# Altium schematic sheet IMX6ULL_CORE.SchDoc
size A3; SheetNumber: 1; SheetTotal: 3
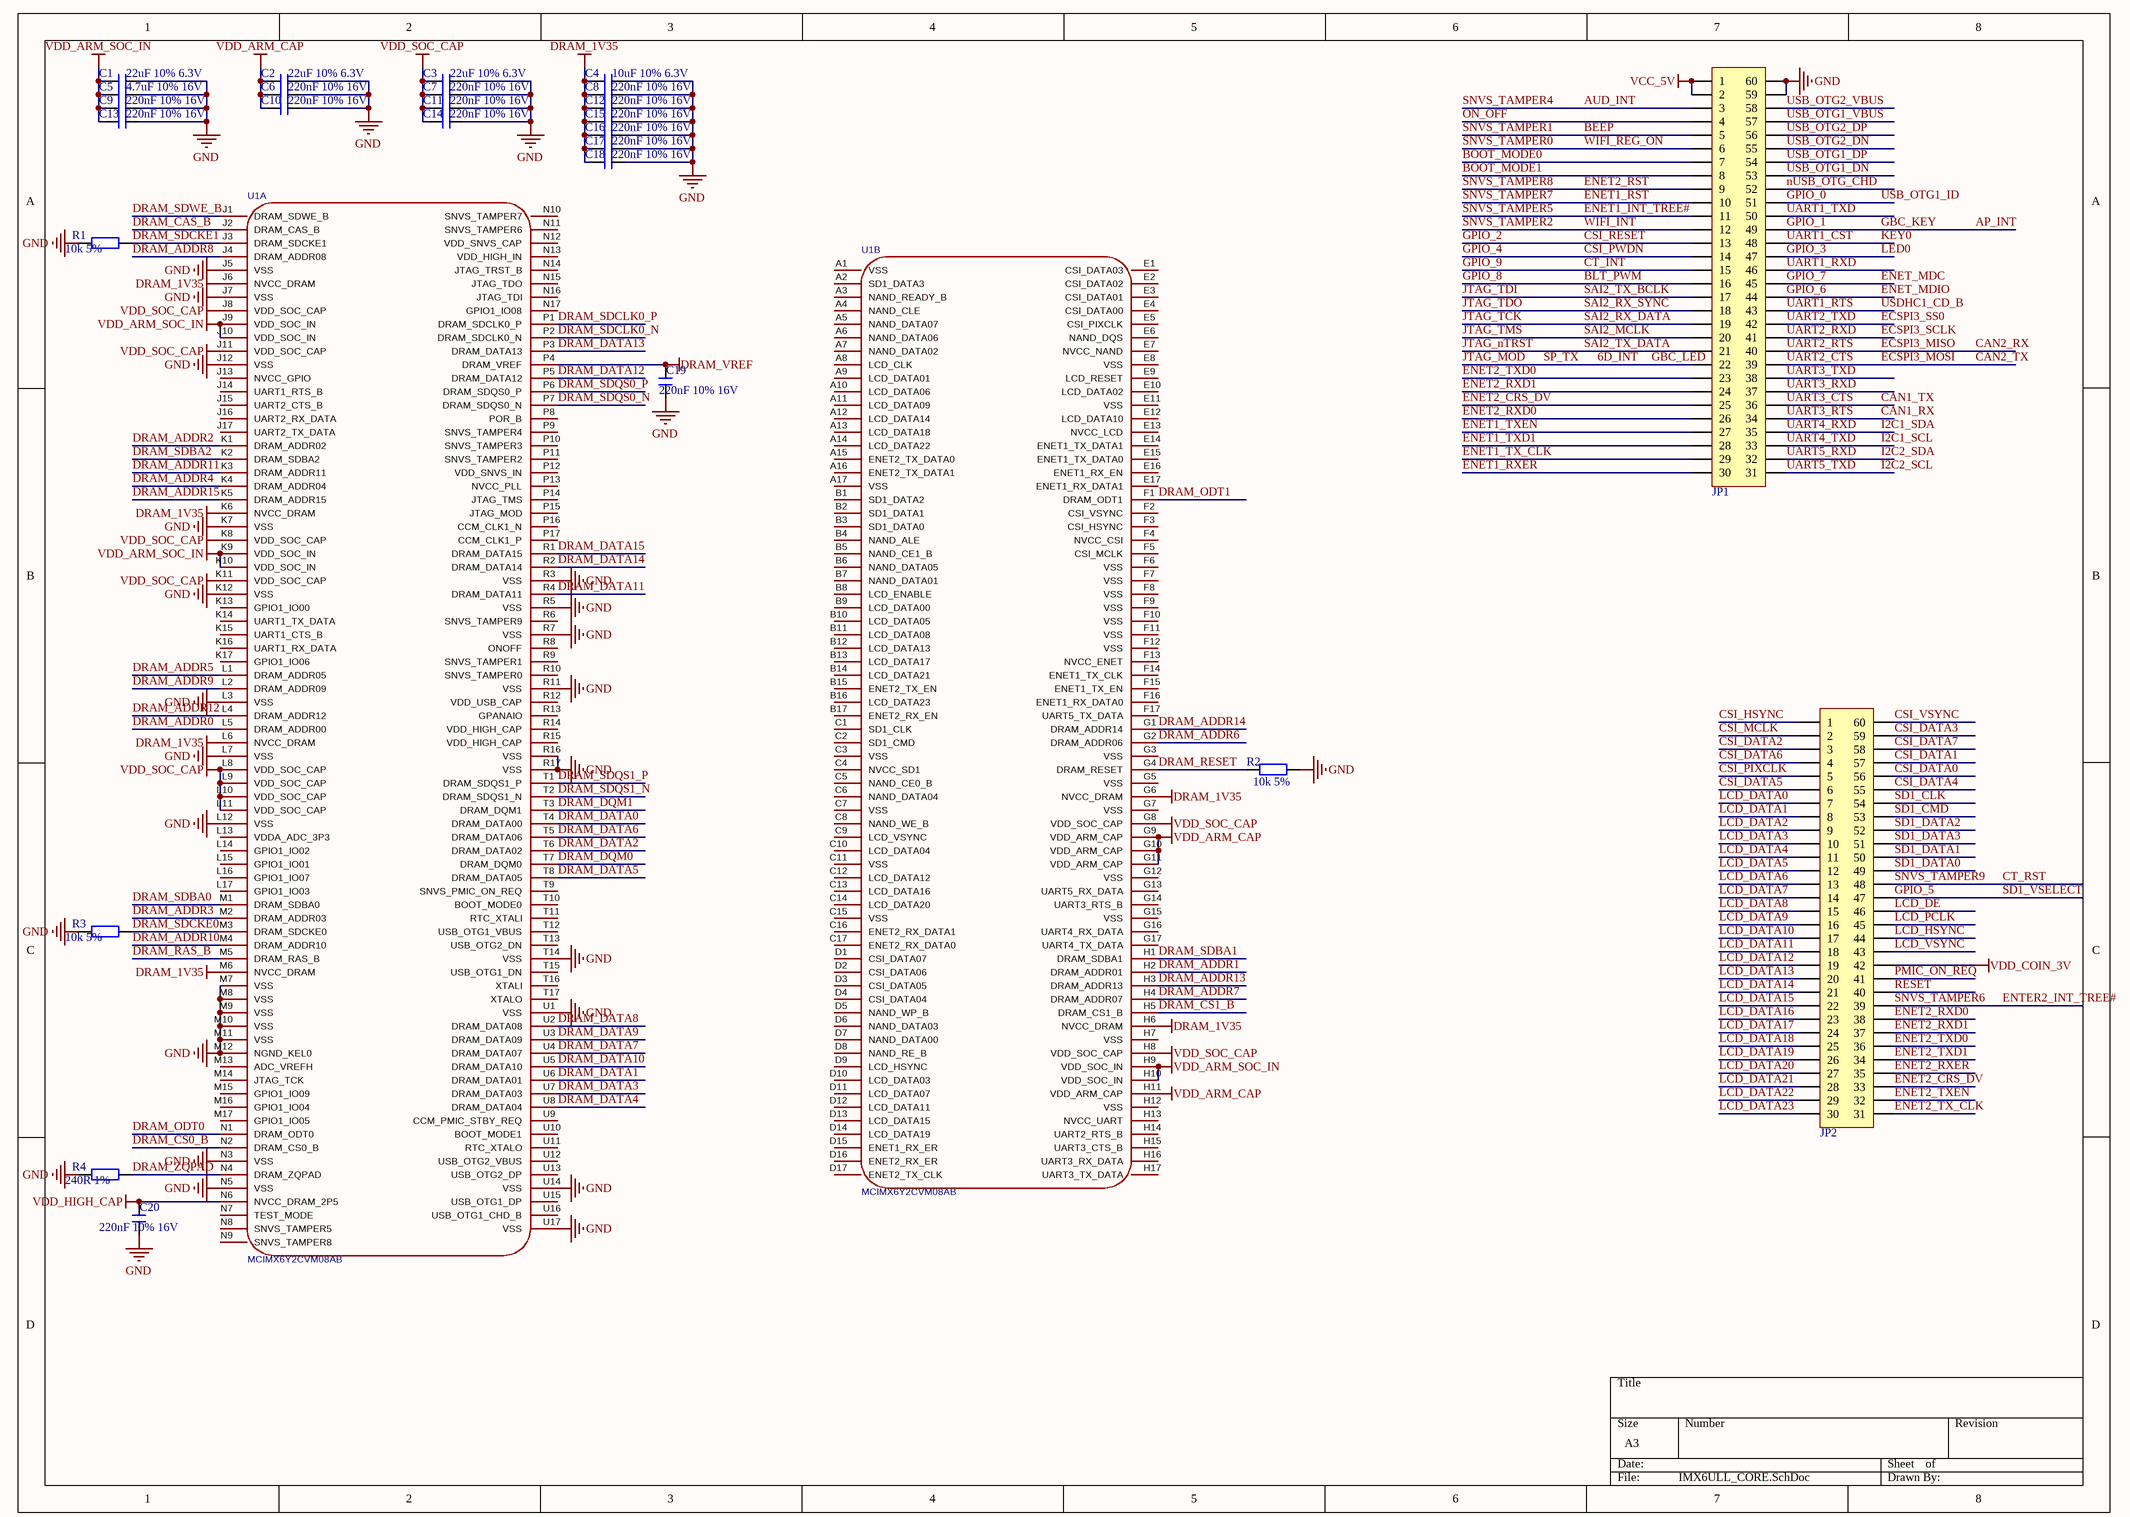
[diagram p0: IMX6ULL_CORE.SchDoc]

## Parts
C1  22uF 10% 6.3V  [C0603_L]
C2  22uF 10% 6.3V  [C0603_L]
C3  22uF 10% 6.3V  [C0603_L]
C4  10uF 10% 6.3V  [C0603_L]
C5  4.7uF 10% 16V  [C0603_L]
C6  220nF 10% 16V  [C0603_L]
C7  220nF 10% 16V  [C0603_L]
C8  220nF 10% 16V  [C0603_L]
C9  220nF 10% 16V  [C0603_L]
C10  220nF 10% 16V  [C0603_L]
C11  220nF 10% 16V  [C0603_L]
C12  220nF 10% 16V  [C0603_L]
C13  220nF 10% 16V  [C0603_L]
C14  220nF 10% 16V  [C0603_L]
C15  220nF 10% 16V  [C0603_L]
C16  220nF 10% 16V  [C0603_L]
C17  220nF 10% 16V  [C0603_L]
C18  220nF 10% 16V  [C0603_L]
C19  220nF 10% 16V  [C0603_L]
C20  220nF 10% 16V  [C0603_L]
JP1  Header 2X30  [IDC2.54-LI-2x30P]  (value not drawn)
JP2  Header 2X30  [IDC2.54-LI-2x30P]  (value not drawn)
R1  10k 5%  [R0603_L]
R2  10k 5%  [R0603_L]
R3  10k 5%  [R0603_L]
R4  240R 1%  [R0603_L]
U1  MCIMX6Y2CVM08AB  [BGA-289_L14.0-W14.0-R17-C17-P0.80-BL]  (parts A,B of 2)

## Nets
DRAM_1V35: C4.1 C8.1 C12.1 C15.1 C16.1 C17.1 C18.1 U1.G6(NVCC_DRAM) U1.H6(NVCC_DRAM) U1.J6(NVCC_DRAM) U1.K6(NVCC_DRAM) U1.L6(NVCC_DRAM) U1.M6(NVCC_DRAM)
DRAM_VREF: C19.2 U1.P4(DRAM_VREF)
GND: C1.2 C2.2 C3.2 C4.2 C5.2 C6.2 C7.2 C8.2 C9.2 C10.2 C11.2 C12.2 C13.2 C14.2 C15.2 C16.2 C17.2 C18.2 C19.1 C20.1 JP1.59 JP1.60 R1.1 R2.2 R3.1 R4.1 U1.J5(VSS) U1.J7(VSS) U1.J12(VSS) U1.K7(VSS) U1.K12(VSS) U1.L3(VSS) U1.L7(VSS) U1.L12(VSS) U1.M7(VSS) U1.M8(VSS) U1.M9(VSS) U1.M10(VSS) U1.M11(VSS) U1.M12(NGND_KEL0) U1.N3(VSS) U1.N5(VSS) U1.R3(VSS) U1.R5(VSS) U1.R7(VSS) U1.R11(VSS) U1.R16(VSS) U1.R17(VSS) U1.T14(VSS) U1.U1(VSS) U1.U14(VSS) U1.U17(VSS)
VCC_5V: JP1.1 JP1.2
VDD_ARM_CAP: C2.1 C6.1 C10.1 U1.G9(VDD_ARM_CAP) U1.G10(VDD_ARM_CAP) U1.G11(VDD_ARM_CAP) U1.H11(VDD_ARM_CAP)
VDD_ARM_SOC_IN: C1.1 C5.1 C9.1 C13.1 U1.H9(VDD_SOC_IN) U1.H10(VDD_SOC_IN) U1.J9(VDD_SOC_IN) U1.J10(VDD_SOC_IN) U1.K9(VDD_SOC_IN) U1.K10(VDD_SOC_IN)
VDD_COIN_3V: JP2.42
VDD_HIGH_CAP: C20.2 U1.N6(NVCC_DRAM_2P5)
VDD_SOC_CAP: C3.1 C7.1 C11.1 C14.1 U1.G8(VDD_SOC_CAP) U1.H8(VDD_SOC_CAP) U1.J8(VDD_SOC_CAP) U1.J11(VDD_SOC_CAP) U1.K8(VDD_SOC_CAP) U1.K11(VDD_SOC_CAP) U1.L8(VDD_SOC_CAP) U1.L9(VDD_SOC_CAP) U1.L10(VDD_SOC_CAP) U1.L11(VDD_SOC_CAP)
6D_INT: JP1.22  [also labelled GBC_LED, JTAG_MOD, SP_TX]
AP_INT: JP1.49  [also labelled GBC_KEY, GPIO_1]
AUD_INT: JP1.3  [also labelled SNVS_TAMPER4]
BEEP: JP1.5  [also labelled SNVS_TAMPER1]
BLT_PWM: JP1.16  [also labelled GPIO_8]
BOOT_MODE0: JP1.7
BOOT_MODE1: JP1.8
CAN1_RX: JP1.34  [also labelled UART3_RTS]
CAN1_TX: JP1.36  [also labelled UART3_CTS]
CAN2_RX: JP1.40  [also labelled ECSPI3_MISO, UART2_RTS]
CAN2_TX: JP1.39  [also labelled ECSPI3_MOSI, UART2_CTS]
CSI_DATA0: JP2.56
CSI_DATA1: JP2.57
CSI_DATA2: JP2.3
CSI_DATA3: JP2.59
CSI_DATA4: JP2.55
CSI_DATA5: JP2.6
CSI_DATA6: JP2.4
CSI_DATA7: JP2.58
CSI_HSYNC: JP2.1
CSI_MCLK: JP2.2
CSI_PIXCLK: JP2.5
CSI_PWDN: JP1.14  [also labelled GPIO_4]
CSI_RESET: JP1.13  [also labelled GPIO_2]
CSI_VSYNC: JP2.60
CT_INT: JP1.15  [also labelled GPIO_9]
CT_RST: JP2.48  [also labelled SNVS_TAMPER9]
DRAM_ADDR0: U1.L5(DRAM_ADDR00)
DRAM_ADDR1: U1.H2(DRAM_ADDR01)
DRAM_ADDR2: U1.K1(DRAM_ADDR02)
DRAM_ADDR3: U1.M2(DRAM_ADDR03)
DRAM_ADDR4: U1.K4(DRAM_ADDR04)
DRAM_ADDR5: U1.L1(DRAM_ADDR05)
DRAM_ADDR6: U1.G2(DRAM_ADDR06)
DRAM_ADDR7: U1.H4(DRAM_ADDR07)
DRAM_ADDR8: U1.J4(DRAM_ADDR08)
DRAM_ADDR9: U1.L2(DRAM_ADDR09)
DRAM_ADDR10: U1.M4(DRAM_ADDR10)
DRAM_ADDR11: U1.K3(DRAM_ADDR11)
DRAM_ADDR12: U1.L4(DRAM_ADDR12)
DRAM_ADDR13: U1.H3(DRAM_ADDR13)
DRAM_ADDR14: U1.G1(DRAM_ADDR14)
DRAM_ADDR15: U1.K5(DRAM_ADDR15)
DRAM_CAS_B: U1.J2(DRAM_CAS_B)
DRAM_CS0_B: U1.N2(DRAM_CS0_B)
DRAM_CS1_B: U1.H5(DRAM_CS1_B)
DRAM_DATA0: U1.T4(DRAM_DATA00)
DRAM_DATA1: U1.U6(DRAM_DATA01)
DRAM_DATA2: U1.T6(DRAM_DATA02)
DRAM_DATA3: U1.U7(DRAM_DATA03)
DRAM_DATA4: U1.U8(DRAM_DATA04)
DRAM_DATA5: U1.T8(DRAM_DATA05)
DRAM_DATA6: U1.T5(DRAM_DATA06)
DRAM_DATA7: U1.U4(DRAM_DATA07)
DRAM_DATA8: U1.U2(DRAM_DATA08)
DRAM_DATA9: U1.U3(DRAM_DATA09)
DRAM_DATA10: U1.U5(DRAM_DATA10)
DRAM_DATA11: U1.R4(DRAM_DATA11)
DRAM_DATA12: U1.P5(DRAM_DATA12)
DRAM_DATA13: U1.P3(DRAM_DATA13)
DRAM_DATA14: U1.R2(DRAM_DATA14)
DRAM_DATA15: U1.R1(DRAM_DATA15)
DRAM_DQM0: U1.T7(DRAM_DQM0)
DRAM_DQM1: U1.T3(DRAM_DQM1)
DRAM_ODT0: U1.N1(DRAM_ODT0)
DRAM_ODT1: U1.F1(DRAM_ODT1)
DRAM_RAS_B: U1.M5(DRAM_RAS_B)
DRAM_RESET: R2.1 U1.G4(DRAM_RESET)
DRAM_SDBA0: U1.M1(DRAM_SDBA0)
DRAM_SDBA1: U1.H1(DRAM_SDBA1)
DRAM_SDBA2: U1.K2(DRAM_SDBA2)
DRAM_SDCKE0: R3.2 U1.M3(DRAM_SDCKE0)
DRAM_SDCKE1: R1.2 U1.J3(DRAM_SDCKE1)
DRAM_SDCLK0_N: U1.P2(DRAM_SDCLK0_N)
DRAM_SDCLK0_P: U1.P1(DRAM_SDCLK0_P)
DRAM_SDQS0_N: U1.P7(DRAM_SDQS0_N)
DRAM_SDQS0_P: U1.P6(DRAM_SDQS0_P)
DRAM_SDQS1_N: U1.T2(DRAM_SDQS1_N)
DRAM_SDQS1_P: U1.T1(DRAM_SDQS1_P)
DRAM_SDWE_B: U1.J1(DRAM_SDWE_B)
DRAM_ZQPAD: R4.2 U1.N4(DRAM_ZQPAD)
ECSPI3_SCLK: JP1.41  [also labelled UART2_RXD]
ECSPI3_SS0: JP1.42  [also labelled UART2_TXD]
ENET1_INT_TREE#: JP1.11  [also labelled SNVS_TAMPER5]
ENET1_RST: JP1.10  [also labelled SNVS_TAMPER7]
ENET1_RXER: JP1.30
ENET1_TX_CLK: JP1.29
ENET1_TXD1: JP1.28
ENET1_TXEN: JP1.27
ENET2_CRS_DV: JP1.25 JP2.33
ENET2_RST: JP1.9  [also labelled SNVS_TAMPER8]
ENET2_RXD0: JP1.26 JP2.38
ENET2_RXD1: JP1.24 JP2.37
ENET2_RXER: JP2.35
ENET2_TX_CLK: JP2.31
ENET2_TXD0: JP1.23 JP2.36
ENET2_TXD1: JP2.34
ENET2_TXEN: JP2.32
ENET_MDC: JP1.45  [also labelled GPIO_7]
ENET_MDIO: JP1.44  [also labelled GPIO_6]
ENTER2_INT_TREE#: JP2.39  [also labelled SNVS_TAMPER6]
GPIO_0: JP1.51  [also labelled USB_OTG1_ID]
GPIO_3: JP1.47  [also labelled LED0]
GPIO_5: JP2.47  [also labelled SD1_VSELECT]
I2C1_SCL: JP1.33  [also labelled UART4_TXD]
I2C1_SDA: JP1.35  [also labelled UART4_RXD]
I2C2_SCL: JP1.31  [also labelled UART5_TXD]
I2C2_SDA: JP1.32  [also labelled UART5_RXD]
JTAG_nTRST: JP1.21  [also labelled SAI2_TX_DATA]
JTAG_TCK: JP1.19  [also labelled SAI2_RX_DATA]
JTAG_TDI: JP1.17  [also labelled SAI2_TX_BCLK]
JTAG_TDO: JP1.18  [also labelled SAI2_RX_SYNC]
JTAG_TMS: JP1.20  [also labelled SAI2_MCLK]
KEY0: JP1.48  [also labelled UART1_CST]
LCD_DATA0: JP2.7
LCD_DATA1: JP2.8
LCD_DATA2: JP2.9
LCD_DATA3: JP2.10
LCD_DATA4: JP2.11
LCD_DATA5: JP2.12
LCD_DATA6: JP2.13
LCD_DATA7: JP2.14
LCD_DATA8: JP2.15
LCD_DATA9: JP2.16
LCD_DATA10: JP2.17
LCD_DATA11: JP2.18
LCD_DATA12: JP2.19
LCD_DATA13: JP2.20
LCD_DATA14: JP2.21
LCD_DATA15: JP2.22
LCD_DATA16: JP2.23
LCD_DATA17: JP2.24
LCD_DATA18: JP2.25
LCD_DATA19: JP2.26
LCD_DATA20: JP2.27
LCD_DATA21: JP2.28
LCD_DATA22: JP2.29
LCD_DATA23: JP2.30
LCD_DE: JP2.46
LCD_HSYNC: JP2.44
LCD_PCLK: JP2.45
LCD_VSYNC: JP2.43
nUSB_OTG_CHD: JP1.52
ON_OFF: JP1.4
PMIC_ON_REQ: JP2.41
RESET: JP2.40
SD1_CLK: JP2.54
SD1_CMD: JP2.53
SD1_DATA0: JP2.49
SD1_DATA1: JP2.50
SD1_DATA2: JP2.52
SD1_DATA3: JP2.51
SNVS_TAMPER0: JP1.6  [also labelled WIFI_REG_ON]
SNVS_TAMPER2: JP1.12  [also labelled WIFI_INT]
UART1_RTS: JP1.43  [also labelled USDHC1_CD_B]
UART1_RXD: JP1.46
UART1_TXD: JP1.50
UART3_RXD: JP1.37
UART3_TXD: JP1.38
USB_OTG1_DN: JP1.53
USB_OTG1_DP: JP1.54
USB_OTG1_VBUS: JP1.57
USB_OTG2_DN: JP1.55
USB_OTG2_DP: JP1.56
USB_OTG2_VBUS: JP1.58

Not connected (* = marked no-connect by the designer): U1 A1(VSS) A2(SD1_DATA3) A3(NAND_READY_B) A4(NAND_CLE) A5(NAND_DATA07) A6(NAND_DATA06) A7(NAND_DATA02) A8(LCD_CLK) A9(LCD_DATA01) A10(LCD_DATA06) A11(LCD_DATA09) A12(LCD_DATA14) A13(LCD_DATA18) A14(LCD_DATA22) A15(ENET2_TX_DATA0) A16(ENET2_TX_DATA1) A17(VSS) B1(SD1_DATA2) B2(SD1_DATA1) B3(SD1_DATA0) B4(NAND_ALE) B5(NAND_CE1_B) B6(NAND_DATA05) B7(NAND_DATA01) B8(LCD_ENABLE) B9(LCD_DATA00) B10(LCD_DATA05) B11(LCD_DATA08) B12(LCD_DATA13) B13(LCD_DATA17) B14(LCD_DATA21) B15(ENET2_TX_EN) B16(LCD_DATA23) B17(ENET2_RX_EN) C1(SD1_CLK) C2(SD1_CMD) C3(VSS) C4(NVCC_SD1) C5(NAND_CE0_B) C6(NAND_DATA04) C7(VSS) C8(NAND_WE_B) C9(LCD_VSYNC) C10(LCD_DATA04) C11(VSS) C12(LCD_DATA12) C13(LCD_DATA16) C14(LCD_DATA20) C15(VSS) C16(ENET2_RX_DATA1) C17(ENET2_RX_DATA0) D1(CSI_DATA07) D2(CSI_DATA06) D3(CSI_DATA05) D4(CSI_DATA04) D5(NAND_WP_B) D6(NAND_DATA03) D7(NAND_DATA00) D8(NAND_RE_B) D9(LCD_HSYNC) D10(LCD_DATA03) D11(LCD_DATA07) D12(LCD_DATA11) D13(LCD_DATA15) D14(LCD_DATA19) D15(ENET1_RX_ER) D16(ENET2_RX_ER) D17(ENET2_TX_CLK) E1(CSI_DATA03) E2(CSI_DATA02) E3(CSI_DATA01) E4(CSI_DATA00) E5(CSI_PIXCLK) E6(NAND_DQS) E7(NVCC_NAND) E8(VSS) E9(LCD_RESET) E10(LCD_DATA02) E11(VSS) E12(LCD_DATA10) E13(NVCC_LCD) E14(ENET1_TX_DATA1) E15(ENET1_TX_DATA0) E16(ENET1_RX_EN) E17(ENET1_RX_DATA1) F2(CSI_VSYNC) F3(CSI_HSYNC) F4(NVCC_CSI) F5(CSI_MCLK) F6(VSS) F7(VSS) F8(VSS) F9(VSS) F10(VSS) F11(VSS) F12(VSS) F13(NVCC_ENET) F14(ENET1_TX_CLK) F15(ENET1_TX_EN) F16(ENET1_RX_DATA0) F17(UART5_TX_DATA) G3(VSS) G5(VSS) G7(VSS) G12(VSS) G13(UART5_RX_DATA) G14(UART3_RTS_B) G15(VSS) G16(UART4_RX_DATA) G17(UART4_TX_DATA) H7(VSS) H12(VSS) H13(NVCC_UART) H14(UART2_RTS_B) H15(UART3_CTS_B) H16(UART3_RX_DATA) H17(UART3_TX_DATA) J13(NVCC_GPIO) J14(UART1_RTS_B) J15(UART2_CTS_B) J16(UART2_RX_DATA) J17(UART2_TX_DATA) K13(GPIO1_IO00) K14(UART1_TX_DATA) K15(UART1_CTS_B) K16(UART1_RX_DATA) K17(GPIO1_IO06) L13(VDDA_ADC_3P3) L14(GPIO1_IO02) L15(GPIO1_IO01) L16(GPIO1_IO07) L17(GPIO1_IO03) M13(ADC_VREFH) M14(JTAG_TCK) M15(GPIO1_IO09) M16(GPIO1_IO04) M17(GPIO1_IO05) N7(TEST_MODE) N8(SNVS_TAMPER5) N9(SNVS_TAMPER8) N10(SNVS_TAMPER7) N11(SNVS_TAMPER6) N12(VDD_SNVS_CAP) N13(VDD_HIGH_IN) N14(JTAG_TRST_B) N15(JTAG_TDO) N16(JTAG_TDI) N17(GPIO1_IO08) P8(POR_B) P9(SNVS_TAMPER4) P10(SNVS_TAMPER3) P11(SNVS_TAMPER2) P12(VDD_SNVS_IN) P13(NVCC_PLL) P14(JTAG_TMS) P15(JTAG_MOD) P16(CCM_CLK1_N) P17(CCM_CLK1_P) R6(SNVS_TAMPER9) R8(ONOFF) R9(SNVS_TAMPER1) R10(SNVS_TAMPER0) R12(VDD_USB_CAP) R13(GPANAIO) R14(VDD_HIGH_CAP) R15(VDD_HIGH_CAP) T9(SNVS_PMIC_ON_REQ) T10(BOOT_MODE0) T11(RTC_XTALI) T12(USB_OTG1_VBUS) T13(USB_OTG2_DN) T15(USB_OTG1_DN) T16(XTALI) T17(XTALO) U9(CCM_PMIC_STBY_REQ) U10(BOOT_MODE1) U11(RTC_XTALO) U12(USB_OTG2_VBUS) U13(USB_OTG2_DP) U15(USB_OTG1_DP) U16(USB_OTG1_CHD_B)

## Library data of the parts
C1-C20 = C: 贴片电容; BOM名称: 无极性贴片电容; 优秀评价可免费更新: 联系淘宝ID：黄晶宝石，获取更新版封装库; 卖家免费技术支持，联系售后: 唯一出售店铺网址https://shop463601444.taobao.com; 本封装库来自淘宝卖家 ID：黄晶宝石: 其他店铺购入均为盗版，请立即申请退款
JP1 JP2 = Header 30X2: 30*2P接插件; BOM名称: 20*2P接插件; 联系卖家，免费查找封装: 唯一出售店铺网址https://shop463601444.taobao.com; 封装库来自淘宝卖家ID：黄晶宝石: 其他店铺购入均为盗版封装库，请立即申请退款，本店现金奖励50~200元
R1-R4 = R: 贴片电阻; 优秀评价可免费更新: 联系淘宝ID：黄晶宝石，获取更新版封装库; 卖家免费技术支持，联系售后: 唯一出售店铺网址https://shop463601444.taobao.com; 本封装库来自淘宝卖家 ID：黄晶宝石: 其他店铺购入均为盗版，请立即申请退款; BOM名称: 贴片电阻
U1 = MCIMX6Y2CVM08AB: CPU内核:ARM Cortex-A7;CPU最大主频:792MHz;CPU位数:32 Bit;; Manufacturer: NXP(恩智浦); Relevance: []; AddInBom: yes; ModelId: a5b4ce0fea5c4f8daaedcc161a7e0fdb聨0819f05c4eef4c71ace90d822a990e87; ModelName: BGA-289_L14.0-W14.0-H1.4-P0.8; ModelTransform: 551.18,551.18,0,90,0,0,1.403,1.408,0; CPU Maximum Speed: 792MHz; Core Size: 32 Bit; Program Storage Size: 128KB; ADC (Bit): 12bit; Voltage - Supply: 1.8V；2.8V；3.3V; Symbol: MCIMX6Y2CVM08AB; Device: MCIMX6Y2CVM08AB; FootprintName: BGA-289_L14.0-W14.0-R17-C17-P0.80-BL; LCSC Part Name: i.MX 6ULL 工业产品应用处理器; SupplierPart: C414042; ManufacturerPart: MCIMX6Y2CVM08AB; Supplier Footprint: MAPBGA-289(14x14); JLCPCB Part Class: Extended Part; Datasheet: https://www.nxp.com/docs/en/data-sheet/IMX6ULLIEC.pdf; Supplier: LCSC; ConvertToPcb: yes; CPU Core: ARM Cortex-A7; RAM Size: 128KB; Operating Temperature: -40℃~+105℃; Features: 窗口看门狗(WWDG)；独立看门狗(IWDG)；日历功能；上电复位(POR)；真随机数发生器(TRNG)；内置通用定时器；内置温度传感器；可编程看门狗；集成LDO